# Altium project Main_Board.PrjPcb (part 34 of 44)

## Sheet SFP2.SchDoc: SFP2
size A3; Organization: Altium Limited; Address1: L3, 12a Rodborough Rd; Address2: Frenchs Forest; Address3: NSW; Address4: Australia 2086
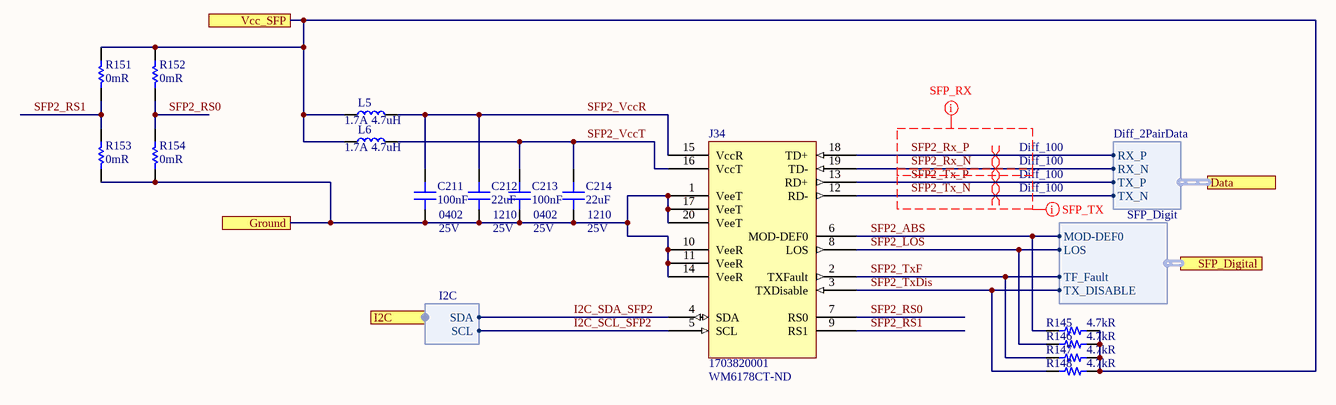
[diagram p54: SFP2.SchDoc]

### Parts
C211  100nF  Case/Package: 0402  Voltage Rating: 25V  [CAP 0402/1005 KK]
C212  22uF  Case/Package: 1210  Voltage Rating: 25V  [CAP 1210/3225 - 1MM]
C213  100nF  Case/Package: 0402  Voltage Rating: 25V  [CAP 0402/1005 KK]
C214  22uF  Case/Package: 1210  Voltage Rating: 25V  [CAP 1210/3225 - 1MM]
J34  1703820001  Supplier Part Number 1: WM6178CT-ND  [1703820001]
L5  Inductance: 4.7uH  Current Rating: 1.7A  [NRS8040]  (hidden comment: NRS4018T4R7MDGJV)
L6  Inductance: 4.7uH  Current Rating: 1.7A  [NRS8040]  (hidden comment: NRS4018T4R7MDGJV)
R145  4.7kR  [RES 0402/1005 RF KK]
R146  4.7kR  [RES 0402/1005 RF KK]
R147  4.7kR  [RES 0402/1005 RF KK]
R148  4.7kR  [RES 0402/1005 RF KK]
R151  0mR  [RES 0402/1005 RF KK]
R152  0mR  [RES 0402/1005 RF KK]
R153  0mR  [RES 0402/1005 RF KK]
R154  0mR  [RES 0402/1005 RF KK]

### Ports
Data (harness Diff_2PairData), Ground, I2C (harness I2C), SFP_Digital (harness SFP_Digit), Vcc_SFP

### Harnesses
I2C: SDA, SCL
SFP_Digit: MOD-DEF0, LOS, TF_Fault, TX_DISABLE
Diff_2PairData: RX_P, RX_N, TX_P, TX_N

### Nets
B503_Ground: C211.1 C212.2 C213.1 C214.2 J34.1(VeeT) J34.10(VeeR) J34.11(VeeR) J34.14(VeeR) J34.17(VeeT) J34.20(VeeT) R153.2 R154.2 ; port Ground
3V3_RAIL: L5.1 L6.1 R145.2 R146.2 R147.2 R148.2 R151.1 R152.1 ; port Vcc_SFP
I2C_SCL_SFP2: J34.5(SCL) ; port I2C.SCL
I2C_SDA_SFP2: J34.4(SDA) ; port I2C.SDA
SFP2_ABS: J34.6(MOD-DEF0) R145.1 ; port SFP_Digital.MOD-DEF0
SFP2_LOS: J34.8(LOS) R146.1 ; port SFP_Digital.LOS
SFP2_RS0: J34.7(RS0) R152.2 R154.1
SFP2_RS1: J34.9(RS1) R151.2 R153.1
SFP2_Rx_N: J34.19(TD-) ; port Data.RX_N
SFP2_Rx_P: J34.18(TD+) ; port Data.RX_P
SFP2_Tx_N: J34.12(RD-) ; port Data.TX_N
SFP2_Tx_P: J34.13(RD+) ; port Data.TX_P
SFP2_TxDis: J34.3(TXDisable) R148.1 ; port SFP_Digital.TX_DISABLE
SFP2_TxF: J34.2(TXFault) R147.1 ; port SFP_Digital.TF_Fault
SFP2_VccR: C211.2 C212.1 J34.15(VccR) L5.2
SFP2_VccT: C213.2 C214.1 J34.16(VccT) L6.2

### Layout directives
differential pair; differential pair class Diff_100: SFP2_Rx_N, SFP2_Rx_P, SFP2_Tx_N, SFP2_Tx_P
net class SFP_RX: SFP2_Rx_N, SFP2_Rx_P
net class SFP_TX: SFP2_Rx_N, SFP2_Tx_N, SFP2_Tx_P

### Notes on the sheet
- Title
- Size:
- Date:
- A3
- Number:
- Time:
- Revision:
- Sheet
- of
- File:

### Library data of the parts
C211 C213 = Capacitor: as C37 on sheet SFP; Supplier 1: Digi-Key; Supplier Part Number 1: 490-14603-1-ND; Stock 1: 89275; Pricing 1: 1 = 0,10000, 10 = 0,03400, 100 = 0,01520, 500 = 0,01088, 1000 = 0,00855, 2500 = 0,00778, 5000 = 0,00715 (USD); RoHS: Yes; Mount: Surface Mount; Weight: 0.000212oz; Case Code (Imperial): 0402; Case Code (Metric): 1005; Min Operating Temperature: -55°C; Max Operating Temperature: 125°C; Packaging: Tape and Reel; Capacitance: 100nF; Termination: SMD/SMT; Composition: Ceramic; Voltage Rating (DC): 25V; Package Quantity: 50000; Length: 0.039inch; Height: 0.5mm; Width: 0.5mm; Thickness: 0.022inch; ComponentLink1URL: http://www.mouser.com/ds/2/281/c02e-2905.pdf?src-supplier=Mouser; ComponentLink1Description: http://www.mouser.com/ds/2/281/c02e-2905.pdf?src-supplier=Mouser; ComponentLink2URL: http://search.murata.co.jp/Ceramy/image/img/A01X/G101/ENG/GRM155R71E104KE14-01.pdf?src-supplier=Digi-Key; ComponentLink2Description: http://search.murata.co.jp/Ceramy/image/img/A01X/G101/ENG/GRM155R71E104KE14-01.pdf?src-supplier=Digi-Key
C212 C214 = Capacitor: as C38 on sheet SFP; Supplier 1: Digi-Key; Supplier Part Number 1: 1276-1101-1-ND; Stock 1: 46396; Pricing 1: 1 = 0,51000, 10 = 0,36300, 100 = 0,23920, 500 = 0,17722 (USD); RoHS: Yes; Mount: Surface Mount; Case Code (Metric): 3225; Case Code (Imperial): 1210; Contact Plating: Tin; Min Operating Temperature: -55°C; Max Operating Temperature: 85°C; Capacitance: 22uF; Packaging: Tape and Reel; Package Quantity: 1; Voltage: 25V; Length: 3.2mm; Height: 2.5mm; Width: 0.098inch; Thickness: 0.106inch; Depth: 2.5mm; Radiation Hardening: No; ComponentLink1URL: https://datasheet.ciiva.com/26947/getdatasheetpartid-358377-26947025.pdf?src-supplier=Verical; ComponentLink1Description: https://datasheet.ciiva.com/26947/getdatasheetpartid-358377-26947025.pdf?src-supplier=Verical; ComponentLink2URL: https://datasheet.ciiva.com/16202/cl32a226kajnnne-16202745.pdf?src-supplier=Future+Electronics; ComponentLink2Description: https://datasheet.ciiva.com/16202/cl32a226kajnnne-16202745.pdf?src-supplier=Future+Electronics; ComponentLink3URL: https://datasheet.ciiva.com/29241/450711-da-01-en-vs-kondensator-1210-29241799.pdf?src-supplier=Conrad; ComponentLink3Description: https://datasheet.ciiva.com/29241/450711-da-01-en-vs-kondensator-1210-29241799.pdf?src-supplier=Conrad
J34 = 1703820001: as J32 on sheet SFP; Supplier 1: Digi-Key; Manufacturer Part Number: 1703820001; RoHS: Yes; Category: Connectors; Stock 1: 248; Pricing 1: 1=2,23000, 10=2,02500, 25=1,90080, 50=1,81820, 100=1,73550 (USD); Mount: Surface Mount; Material: Brass; Contact Plating: Gold; Contact Material: Bronze,Brass,Copper Alloy; Housing Material: Polycarbonate; Housing Color: Black; Min Operating Temperature: -40°C; Max Operating Temperature: 85°C; Number of Positions: 20; Termination: Solder; Number of Positions Loaded: 20; Package Quantity: 960; Number of Contacts: 20; Packaging: Tape and Reel; Max Voltage Rating (DC): 120V; Voltage Rating (AC): 120V; Orientation: Right Angle; Length: 11mm; Pitch: 0.8mm; Depth: 7.87mm; Radiation Hardening: No; REACH SVHC: No SVHC; Halogen Free: Low Halogen; ELV: Compliant; Flammability Rating: UL94 V-0; ComponentLink1URL: https://datasheet.ciiva.com/3966/317371703820001-io-nectors-3966818.pdf?src-supplier=Arrow; ComponentLink1Description: https://datasheet.ciiva.com/3966/317371703820001-io-nectors-3966818.pdf?src-supplier=Arrow; ComponentLink2URL: https://datasheet.ciiva.com/26288/495951703820001-io-nectors-26288395.pdf?src-supplier=Onlinecomponents.com; ComponentLink2Description: https://datasheet.ciiva.com/26288/495951703820001-io-nectors-26288395.pdf?src-supplier=Onlinecomponents.com; ComponentLink3URL: https://datasheet.ciiva.com/26945/getdatasheetpartid-750999-26945324.pdf?src-supplier=Verical; ComponentLink3Description: https://datasheet.ciiva.com/26945/getdatasheetpartid-750999-26945324.pdf?src-supplier=Verical; ComponentLink4URL: https://datasheet.ciiva.com/16077/629941703820001-io-nectors-16077135.pdf?src-supplier=Onlinecomponents.com; ComponentLink4Description: https://datasheet.ciiva.com/16077/629941703820001-io-nectors-16077135.pdf?src-supplier=Onlinecomponents.com; ComponentLink5URL: https://datasheet.ciiva.com/6929/1703820001-sd-6929267.pdf?src-supplier=Digi-Key; ComponentLink5Description: https://datasheet.ciiva.com/6929/1703820001-sd-6929267.pdf?src-supplier=Digi-Key; ComponentLink6URL: https://datasheet.ciiva.com/26915/getdatasheetpartid-410263-26915957.pdf?src-supplier=Verical; ComponentLink6Description: https://datasheet.ciiva.com/26915/getdatasheetpartid-410263-26915957.pdf?src-supplier=Verical; ComponentLink7URL: https://datasheet.ciiva.com/3138/1703820001-io-connectors-3138921.pdf?src-supplier=Avnet; ComponentLink7Description: https://datasheet.ciiva.com/3138/1703820001-io-connectors-3138921.pdf?src-supplier=Avnet; ComponentLink8URL: https://datasheet.ciiva.com/3138/1703820001-io-connectors-3138922.pdf?src-supplier=Avnet; ComponentLink8Description: https://datasheet.ciiva.com/3138/1703820001-io-connectors-3138922.pdf?src-supplier=Avnet; ComponentLink9URL: https://datasheet.ciiva.com/4569/1703820001-io-connectors-230609-4569597.pdf?src-supplier=Mouser; ComponentLink9Description: https://datasheet.ciiva.com/4569/1703820001-io-connectors-230609-4569597.pdf?src-supplier=Mouser
L5 L6 = NRS4018T4R7MDGJV: as L1 on sheet SFP; Supplier 1: Digi-Key; Manufacturer Part Number: NRS4018T4R7MDGJV; RoHS: Yes; Category: Fixed Inductors; Stock 1: 1620; Pricing 1: 1=0,41000, 10=0,35700, 100=0,25500, 500=0,21422, 1000=0,17342 (USD); Mount: Surface Mount; Case/Package: Nonstandard; Weight: 0.003527oz; Core Material: Ferrite; Min Operating Temperature: -40°C; Max Operating Temperature: 125°C; Packaging: Tape and Reel; Tolerance: 20%; Package Quantity: 3500; Shielding: Shielded; Composition: Wirewound; Test Frequency: 100kHz; Max DC Current: 1.7A; Termination: SMD/SMT; Length: 4mm; Height: 1.8mm; Width: 0.157inch; Height - Seated (Max): 0.071inch; Depth: 4mm; Ratings: AEC-Q200; Radiation Hardening: No; Halogen Free: Halogen Free; ComponentLink1URL: https://datasheet.ciiva.com/29697/nrs4018t4r7mdgjv-ss-29697589.pdf?src-supplier=Digi-Key; ComponentLink1Description: https://datasheet.ciiva.com/29697/nrs4018t4r7mdgjv-ss-29697589.pdf?src-supplier=Digi-Key; Supplier Part Number 1: 587-3578-1-ND
R145-R148 = Resistor: as R65-R68 on sheet SFP; Supplier 1: Digi-Key; Supplier Part Number 1: P4.70KLCT-ND; Stock 1: 5361977; Pricing 1: 1 = 0,10000, 10 = 0,05500, 100 = 0,02250, 1000 = 0,01009, 2500 = 0,00876, 5000 = 0,00724 (USD); RoHS: Yes; Mount: Surface Mount; Case/Package: 0402; Number of Pins: 2; Case Code (Imperial): 0402; Case Code (Metric): 1005; Contact Plating: Tin; Min Operating Temperature: -55°C; Max Operating Temperature: 155°C; Resistance: 4.7kR; Packaging: Tape and Reel; Composition: Thick Film; Package Quantity: 1; Termination: SMD/SMT; Voltage Rating (DC): 50V; Number of Terminations: 2; Military Standard: Not; Max Power Dissipation: 100mW; Features: Automotive AEC-Q200; Length: 1mm; Height: 0.35mm; Width: 0.02inch; Depth: 0.5mm; Radiation Hardening: No; Lead Free: Lead Free; REACH SVHC: No SVHC; ComponentLink1URL: https://datasheet.ciiva.com/11821/0900766b80f80784-11821329.pdf?src-supplier=RSComponents; ComponentLink1Description: https://datasheet.ciiva.com/11821/0900766b80f80784-11821329.pdf?src-supplier=RSComponents; ComponentLink2URL: https://datasheet.ciiva.com/30053/aoa0000ce2-30053990.pdf?src-supplier=Onlinecomponents.com; ComponentLink2Description: https://datasheet.ciiva.com/30053/aoa0000ce2-30053990.pdf?src-supplier=Onlinecomponents.com; ComponentLink3URL: https://datasheet.ciiva.com/7830/aoa0000ce2-7830727.pdf?src-supplier=Element14; ComponentLink3Description: https://datasheet.ciiva.com/7830/aoa0000ce2-7830727.pdf?src-supplier=Element14; ComponentLink4URL: https://datasheet.ciiva.com/22781/1678782-22781576.pdf?src-supplier=Farnell; ComponentLink4Description: https://datasheet.ciiva.com/22781/1678782-22781576.pdf?src-supplier=Farnell; ComponentLink5URL: https://datasheet.ciiva.com/9195/aoa0000ce2-9195737.pdf?src-supplier=Avnet; ComponentLink5Description: https://datasheet.ciiva.com/9195/aoa0000ce2-9195737.pdf?src-supplier=Avnet; ComponentLink6URL: https://datasheet.ciiva.com/17213/aoa0000ce2-17213180.pdf?src-supplier=Avnet+Europe; ComponentLink6Description: https://datasheet.ciiva.com/17213/aoa0000ce2-17213180.pdf?src-supplier=Avnet+Europe; ComponentLink7URL: https://datasheet.ciiva.com/22667/1678782-22667886.pdf?src-supplier=Element14; ComponentLink7Description: https://datasheet.ciiva.com/22667/1678782-22667886.pdf?src-supplier=Element14; ComponentLink8URL: https://datasheet.ciiva.com/16763/70260748-16763151.pdf?src-supplier=Allied+Electronics; ComponentLink8Description: https://datasheet.ciiva.com/16763/70260748-16763151.pdf?src-supplier=Allied+Electronics; ComponentLink9URL: https://datasheet.ciiva.com/22723/1678782-22723903.pdf?src-supplier=Element14; ComponentLink9Description: https://datasheet.ciiva.com/22723/1678782-22723903.pdf?src-supplier=Element14; ComponentLink10URL: https://datasheet.ciiva.com/24025/aoa0000ce2-24025663.pdf?src-supplier=Mouser; ComponentLink10Description: https://datasheet.ciiva.com/24025/aoa0000ce2-24025663.pdf?src-supplier=Mouser
R151-R154 = Resistor: as R703#1 on sheet Ext_GPIO_Bank2; Supplier 1: Digi-Key; Supplier Part Number 1: 311-0.0JRCT-ND; Stock 1: 69822252; Pricing 1: 1=0.10000, 10=0.01200, 25=0.00920, 50=0.00680, 100=0.00510, 250=0.00388, 500=0.00308, 1000=0.00227, 5000=0.00163 (USD); RoHS: Yes; Case/Package: 0402; Contact Plating: Tin,Matte; Case Code (Metric): 1005; Case Code (Imperial): 0402; Min Operating Temperature: -55°C; Max Operating Temperature: 155°C; Resistance: 0mR; Packaging: Tape and Reel; Composition: Thick Film; Package Quantity: 1; Number of Terminations: 2; Termination: SMD/SMT; Military Standard: Not; Features: Moisture Resistant; Length: 1mm; Height: 0.016inch; Width: 0.02inch; Depth: 0.5mm; Radiation Hardening: No; REACH SVHC: Unknown; Lead Free: Lead Free; ComponentLink1URL: https://datasheet.ciiva.com/2452/pyu-rc0402-51-rohs-l-6-2452608.pdf?src-supplier=Digi-Key; ComponentLink1Description: https://datasheet.ciiva.com/2452/pyu-rc0402-51-rohs-l-6-2452608.pdf?src-supplier=Digi-Key; ComponentLink2URL: https://datasheet.ciiva.com/11808/0900766b80c66297-11808195.pdf?src-supplier=RSComponents; ComponentLink2Description: https://datasheet.ciiva.com/11808/0900766b80c66297-11808195.pdf?src-supplier=RSComponents; ComponentLink3URL: https://datasheet.ciiva.com/2452/pyu-r-int-thick-7-2452609.pdf?src-supplier=Digi-Key; ComponentLink3Description: https://datasheet.ciiva.com/2452/pyu-r-int-thick-7-2452609.pdf?src-supplier=Digi-Key; ComponentLink4URL: https://datasheet.ciiva.com/22747/1018594-22747515.pdf?src-supplier=Element14; ComponentLink4Description: https://datasheet.ciiva.com/22747/1018594-22747515.pdf?src-supplier=Element14; ComponentLink5URL: https://datasheet.ciiva.com/7983/1018594-7983535.pdf?src-supplier=Element14; ComponentLink5Description: https://datasheet.ciiva.com/7983/1018594-7983535.pdf?src-supplier=Element14; ComponentLink6URL: https://datasheet.ciiva.com/2452/pyu-r-int-thick-7-2452610.pdf?src-supplier=Digi-Key; ComponentLink6Description: https://datasheet.ciiva.com/2452/pyu-r-int-thick-7-2452610.pdf?src-supplier=Digi-Key; ComponentLink7URL: https://datasheet.ciiva.com/8896/pyu-rc0402-51-rohs-l-6-8896201.pdf?src-supplier=Avnet; ComponentLink7Description: https://datasheet.ciiva.com/8896/pyu-rc0402-51-rohs-l-6-8896201.pdf?src-supplier=Avnet; ComponentLink8URL: https://datasheet.ciiva.com/28386/pyu-rc0402-51-rohs-l-6-28386633.pdf?src-supplier=Avnet+Europe; ComponentLink8Description: https://datasheet.ciiva.com/28386/pyu-rc0402-51-rohs-l-6-28386633.pdf?src-supplier=Avnet+Europe; ComponentLink9URL: https://datasheet.ciiva.com/15189/getdatasheetpartid-326379-15189533.pdf?src-supplier=Verical; ComponentLink9Description: https://datasheet.ciiva.com/15189/getdatasheetpartid-326379-15189533.pdf?src-supplier=Verical

## Sheet SFP3.SchDoc: SFP3
size A3; Organization: Altium Limited; Address1: L3, 12a Rodborough Rd; Address2: Frenchs Forest; Address3: NSW; Address4: Australia 2086
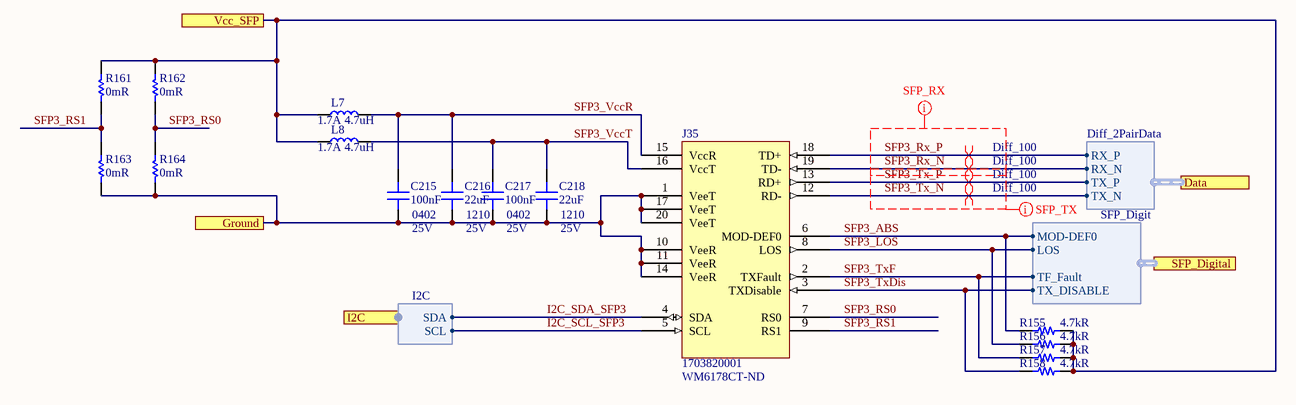
[diagram p55: SFP3.SchDoc]

### Parts
C215  100nF  Case/Package: 0402  Voltage Rating: 25V  [CAP 0402/1005 KK]
C216  22uF  Case/Package: 1210  Voltage Rating: 25V  [CAP 1210/3225 - 1MM]
C217  100nF  Case/Package: 0402  Voltage Rating: 25V  [CAP 0402/1005 KK]
C218  22uF  Case/Package: 1210  Voltage Rating: 25V  [CAP 1210/3225 - 1MM]
J35  1703820001  Supplier Part Number 1: WM6178CT-ND  [1703820001]
L7  Inductance: 4.7uH  Current Rating: 1.7A  [NRS8040]  (hidden comment: NRS4018T4R7MDGJV)
L8  Inductance: 4.7uH  Current Rating: 1.7A  [NRS8040]  (hidden comment: NRS4018T4R7MDGJV)
R155  4.7kR  [RES 0402/1005 RF KK]
R156  4.7kR  [RES 0402/1005 RF KK]
R157  4.7kR  [RES 0402/1005 RF KK]
R158  4.7kR  [RES 0402/1005 RF KK]
R161  0mR  [RES 0402/1005 RF KK]
R162  0mR  [RES 0402/1005 RF KK]
R163  0mR  [RES 0402/1005 RF KK]
R164  0mR  [RES 0402/1005 RF KK]

### Ports
Data (harness Diff_2PairData), Ground, I2C (harness I2C), SFP_Digital (harness SFP_Digit), Vcc_SFP

### Harnesses
I2C: SDA, SCL
SFP_Digit: MOD-DEF0, LOS, TF_Fault, TX_DISABLE
Diff_2PairData: RX_P, RX_N, TX_P, TX_N

### Nets
B503_Ground: C215.1 C216.2 C217.1 C218.2 J35.1(VeeT) J35.10(VeeR) J35.11(VeeR) J35.14(VeeR) J35.17(VeeT) J35.20(VeeT) R163.2 R164.2 ; port Ground
3V3_RAIL: L7.1 L8.1 R155.2 R156.2 R157.2 R158.2 R161.1 R162.1 ; port Vcc_SFP
I2C_SCL_SFP3: J35.5(SCL) ; port I2C.SCL
I2C_SDA_SFP3: J35.4(SDA) ; port I2C.SDA
SFP3_ABS: J35.6(MOD-DEF0) R155.1 ; port SFP_Digital.MOD-DEF0
SFP3_LOS: J35.8(LOS) R156.1 ; port SFP_Digital.LOS
SFP3_RS0: J35.7(RS0) R162.2 R164.1
SFP3_RS1: J35.9(RS1) R161.2 R163.1
SFP3_Rx_N: J35.19(TD-) ; port Data.RX_N
SFP3_Rx_P: J35.18(TD+) ; port Data.RX_P
SFP3_Tx_N: J35.12(RD-) ; port Data.TX_N
SFP3_Tx_P: J35.13(RD+) ; port Data.TX_P
SFP3_TxDis: J35.3(TXDisable) R158.1 ; port SFP_Digital.TX_DISABLE
SFP3_TxF: J35.2(TXFault) R157.1 ; port SFP_Digital.TF_Fault
SFP3_VccR: C215.2 C216.1 J35.15(VccR) L7.2
SFP3_VccT: C217.2 C218.1 J35.16(VccT) L8.2

### Layout directives
differential pair; differential pair class Diff_100: SFP3_Rx_N, SFP3_Rx_P, SFP3_Tx_N, SFP3_Tx_P
net class SFP_RX: SFP3_Rx_N, SFP3_Rx_P
net class SFP_TX: SFP3_Rx_N, SFP3_Tx_N, SFP3_Tx_P

### Notes on the sheet
- Title
- Size:
- Date:
- A3
- Number:
- Time:
- Revision:
- Sheet
- of
- File:

### Library data of the parts
C215 C217 = Capacitor: as C37 on sheet SFP; Supplier 1: Digi-Key; Supplier Part Number 1: 490-14603-1-ND; Stock 1: 89275; Pricing 1: 1 = 0,10000, 10 = 0,03400, 100 = 0,01520, 500 = 0,01088, 1000 = 0,00855, 2500 = 0,00778, 5000 = 0,00715 (USD); RoHS: Yes; Mount: Surface Mount; Weight: 0.000212oz; Case Code (Imperial): 0402; Case Code (Metric): 1005; Min Operating Temperature: -55°C; Max Operating Temperature: 125°C; Packaging: Tape and Reel; Capacitance: 100nF; Termination: SMD/SMT; Composition: Ceramic; Voltage Rating (DC): 25V; Package Quantity: 50000; Length: 0.039inch; Height: 0.5mm; Width: 0.5mm; Thickness: 0.022inch; ComponentLink1URL: http://www.mouser.com/ds/2/281/c02e-2905.pdf?src-supplier=Mouser; ComponentLink1Description: http://www.mouser.com/ds/2/281/c02e-2905.pdf?src-supplier=Mouser; ComponentLink2URL: http://search.murata.co.jp/Ceramy/image/img/A01X/G101/ENG/GRM155R71E104KE14-01.pdf?src-supplier=Digi-Key; ComponentLink2Description: http://search.murata.co.jp/Ceramy/image/img/A01X/G101/ENG/GRM155R71E104KE14-01.pdf?src-supplier=Digi-Key
C216 C218 = Capacitor: as C38 on sheet SFP; Supplier 1: Digi-Key; Supplier Part Number 1: 1276-1101-1-ND; Stock 1: 46396; Pricing 1: 1 = 0,51000, 10 = 0,36300, 100 = 0,23920, 500 = 0,17722 (USD); RoHS: Yes; Mount: Surface Mount; Case Code (Metric): 3225; Case Code (Imperial): 1210; Contact Plating: Tin; Min Operating Temperature: -55°C; Max Operating Temperature: 85°C; Capacitance: 22uF; Packaging: Tape and Reel; Package Quantity: 1; Voltage: 25V; Length: 3.2mm; Height: 2.5mm; Width: 0.098inch; Thickness: 0.106inch; Depth: 2.5mm; Radiation Hardening: No; ComponentLink1URL: https://datasheet.ciiva.com/26947/getdatasheetpartid-358377-26947025.pdf?src-supplier=Verical; ComponentLink1Description: https://datasheet.ciiva.com/26947/getdatasheetpartid-358377-26947025.pdf?src-supplier=Verical; ComponentLink2URL: https://datasheet.ciiva.com/16202/cl32a226kajnnne-16202745.pdf?src-supplier=Future+Electronics; ComponentLink2Description: https://datasheet.ciiva.com/16202/cl32a226kajnnne-16202745.pdf?src-supplier=Future+Electronics; ComponentLink3URL: https://datasheet.ciiva.com/29241/450711-da-01-en-vs-kondensator-1210-29241799.pdf?src-supplier=Conrad; ComponentLink3Description: https://datasheet.ciiva.com/29241/450711-da-01-en-vs-kondensator-1210-29241799.pdf?src-supplier=Conrad
J35 = 1703820001: as J32 on sheet SFP; Supplier 1: Digi-Key; Manufacturer Part Number: 1703820001; RoHS: Yes; Category: Connectors; Stock 1: 248; Pricing 1: 1=2,23000, 10=2,02500, 25=1,90080, 50=1,81820, 100=1,73550 (USD); Mount: Surface Mount; Material: Brass; Contact Plating: Gold; Contact Material: Bronze,Brass,Copper Alloy; Housing Material: Polycarbonate; Housing Color: Black; Min Operating Temperature: -40°C; Max Operating Temperature: 85°C; Number of Positions: 20; Termination: Solder; Number of Positions Loaded: 20; Package Quantity: 960; Number of Contacts: 20; Packaging: Tape and Reel; Max Voltage Rating (DC): 120V; Voltage Rating (AC): 120V; Orientation: Right Angle; Length: 11mm; Pitch: 0.8mm; Depth: 7.87mm; Radiation Hardening: No; REACH SVHC: No SVHC; Halogen Free: Low Halogen; ELV: Compliant; Flammability Rating: UL94 V-0; ComponentLink1URL: https://datasheet.ciiva.com/3966/317371703820001-io-nectors-3966818.pdf?src-supplier=Arrow; ComponentLink1Description: https://datasheet.ciiva.com/3966/317371703820001-io-nectors-3966818.pdf?src-supplier=Arrow; ComponentLink2URL: https://datasheet.ciiva.com/26288/495951703820001-io-nectors-26288395.pdf?src-supplier=Onlinecomponents.com; ComponentLink2Description: https://datasheet.ciiva.com/26288/495951703820001-io-nectors-26288395.pdf?src-supplier=Onlinecomponents.com; ComponentLink3URL: https://datasheet.ciiva.com/26945/getdatasheetpartid-750999-26945324.pdf?src-supplier=Verical; ComponentLink3Description: https://datasheet.ciiva.com/26945/getdatasheetpartid-750999-26945324.pdf?src-supplier=Verical; ComponentLink4URL: https://datasheet.ciiva.com/16077/629941703820001-io-nectors-16077135.pdf?src-supplier=Onlinecomponents.com; ComponentLink4Description: https://datasheet.ciiva.com/16077/629941703820001-io-nectors-16077135.pdf?src-supplier=Onlinecomponents.com; ComponentLink5URL: https://datasheet.ciiva.com/6929/1703820001-sd-6929267.pdf?src-supplier=Digi-Key; ComponentLink5Description: https://datasheet.ciiva.com/6929/1703820001-sd-6929267.pdf?src-supplier=Digi-Key; ComponentLink6URL: https://datasheet.ciiva.com/26915/getdatasheetpartid-410263-26915957.pdf?src-supplier=Verical; ComponentLink6Description: https://datasheet.ciiva.com/26915/getdatasheetpartid-410263-26915957.pdf?src-supplier=Verical; ComponentLink7URL: https://datasheet.ciiva.com/3138/1703820001-io-connectors-3138921.pdf?src-supplier=Avnet; ComponentLink7Description: https://datasheet.ciiva.com/3138/1703820001-io-connectors-3138921.pdf?src-supplier=Avnet; ComponentLink8URL: https://datasheet.ciiva.com/3138/1703820001-io-connectors-3138922.pdf?src-supplier=Avnet; ComponentLink8Description: https://datasheet.ciiva.com/3138/1703820001-io-connectors-3138922.pdf?src-supplier=Avnet; ComponentLink9URL: https://datasheet.ciiva.com/4569/1703820001-io-connectors-230609-4569597.pdf?src-supplier=Mouser; ComponentLink9Description: https://datasheet.ciiva.com/4569/1703820001-io-connectors-230609-4569597.pdf?src-supplier=Mouser
L7 L8 = NRS4018T4R7MDGJV: as L1 on sheet SFP; Supplier 1: Digi-Key; Manufacturer Part Number: NRS4018T4R7MDGJV; RoHS: Yes; Category: Fixed Inductors; Stock 1: 1620; Pricing 1: 1=0,41000, 10=0,35700, 100=0,25500, 500=0,21422, 1000=0,17342 (USD); Mount: Surface Mount; Case/Package: Nonstandard; Weight: 0.003527oz; Core Material: Ferrite; Min Operating Temperature: -40°C; Max Operating Temperature: 125°C; Packaging: Tape and Reel; Tolerance: 20%; Package Quantity: 3500; Shielding: Shielded; Composition: Wirewound; Test Frequency: 100kHz; Max DC Current: 1.7A; Termination: SMD/SMT; Length: 4mm; Height: 1.8mm; Width: 0.157inch; Height - Seated (Max): 0.071inch; Depth: 4mm; Ratings: AEC-Q200; Radiation Hardening: No; Halogen Free: Halogen Free; ComponentLink1URL: https://datasheet.ciiva.com/29697/nrs4018t4r7mdgjv-ss-29697589.pdf?src-supplier=Digi-Key; ComponentLink1Description: https://datasheet.ciiva.com/29697/nrs4018t4r7mdgjv-ss-29697589.pdf?src-supplier=Digi-Key; Supplier Part Number 1: 587-3578-1-ND
R155-R158 = Resistor: as R65-R68 on sheet SFP; Supplier 1: Digi-Key; Supplier Part Number 1: P4.70KLCT-ND; Stock 1: 5361977; Pricing 1: 1 = 0,10000, 10 = 0,05500, 100 = 0,02250, 1000 = 0,01009, 2500 = 0,00876, 5000 = 0,00724 (USD); RoHS: Yes; Mount: Surface Mount; Case/Package: 0402; Number of Pins: 2; Case Code (Imperial): 0402; Case Code (Metric): 1005; Contact Plating: Tin; Min Operating Temperature: -55°C; Max Operating Temperature: 155°C; Resistance: 4.7kR; Packaging: Tape and Reel; Composition: Thick Film; Package Quantity: 1; Termination: SMD/SMT; Voltage Rating (DC): 50V; Number of Terminations: 2; Military Standard: Not; Max Power Dissipation: 100mW; Features: Automotive AEC-Q200; Length: 1mm; Height: 0.35mm; Width: 0.02inch; Depth: 0.5mm; Radiation Hardening: No; Lead Free: Lead Free; REACH SVHC: No SVHC; ComponentLink1URL: https://datasheet.ciiva.com/11821/0900766b80f80784-11821329.pdf?src-supplier=RSComponents; ComponentLink1Description: https://datasheet.ciiva.com/11821/0900766b80f80784-11821329.pdf?src-supplier=RSComponents; ComponentLink2URL: https://datasheet.ciiva.com/30053/aoa0000ce2-30053990.pdf?src-supplier=Onlinecomponents.com; ComponentLink2Description: https://datasheet.ciiva.com/30053/aoa0000ce2-30053990.pdf?src-supplier=Onlinecomponents.com; ComponentLink3URL: https://datasheet.ciiva.com/7830/aoa0000ce2-7830727.pdf?src-supplier=Element14; ComponentLink3Description: https://datasheet.ciiva.com/7830/aoa0000ce2-7830727.pdf?src-supplier=Element14; ComponentLink4URL: https://datasheet.ciiva.com/22781/1678782-22781576.pdf?src-supplier=Farnell; ComponentLink4Description: https://datasheet.ciiva.com/22781/1678782-22781576.pdf?src-supplier=Farnell; ComponentLink5URL: https://datasheet.ciiva.com/9195/aoa0000ce2-9195737.pdf?src-supplier=Avnet; ComponentLink5Description: https://datasheet.ciiva.com/9195/aoa0000ce2-9195737.pdf?src-supplier=Avnet; ComponentLink6URL: https://datasheet.ciiva.com/17213/aoa0000ce2-17213180.pdf?src-supplier=Avnet+Europe; ComponentLink6Description: https://datasheet.ciiva.com/17213/aoa0000ce2-17213180.pdf?src-supplier=Avnet+Europe; ComponentLink7URL: https://datasheet.ciiva.com/22667/1678782-22667886.pdf?src-supplier=Element14; ComponentLink7Description: https://datasheet.ciiva.com/22667/1678782-22667886.pdf?src-supplier=Element14; ComponentLink8URL: https://datasheet.ciiva.com/16763/70260748-16763151.pdf?src-supplier=Allied+Electronics; ComponentLink8Description: https://datasheet.ciiva.com/16763/70260748-16763151.pdf?src-supplier=Allied+Electronics; ComponentLink9URL: https://datasheet.ciiva.com/22723/1678782-22723903.pdf?src-supplier=Element14; ComponentLink9Description: https://datasheet.ciiva.com/22723/1678782-22723903.pdf?src-supplier=Element14; ComponentLink10URL: https://datasheet.ciiva.com/24025/aoa0000ce2-24025663.pdf?src-supplier=Mouser; ComponentLink10Description: https://datasheet.ciiva.com/24025/aoa0000ce2-24025663.pdf?src-supplier=Mouser
R161-R164 = Resistor: as R703#1 on sheet Ext_GPIO_Bank2; Supplier 1: Digi-Key; Supplier Part Number 1: 311-0.0JRCT-ND; Stock 1: 69822252; Pricing 1: 1=0.10000, 10=0.01200, 25=0.00920, 50=0.00680, 100=0.00510, 250=0.00388, 500=0.00308, 1000=0.00227, 5000=0.00163 (USD); RoHS: Yes; Case/Package: 0402; Contact Plating: Tin,Matte; Case Code (Metric): 1005; Case Code (Imperial): 0402; Min Operating Temperature: -55°C; Max Operating Temperature: 155°C; Resistance: 0mR; Packaging: Tape and Reel; Composition: Thick Film; Package Quantity: 1; Number of Terminations: 2; Termination: SMD/SMT; Military Standard: Not; Features: Moisture Resistant; Length: 1mm; Height: 0.016inch; Width: 0.02inch; Depth: 0.5mm; Radiation Hardening: No; REACH SVHC: Unknown; Lead Free: Lead Free; ComponentLink1URL: https://datasheet.ciiva.com/2452/pyu-rc0402-51-rohs-l-6-2452608.pdf?src-supplier=Digi-Key; ComponentLink1Description: https://datasheet.ciiva.com/2452/pyu-rc0402-51-rohs-l-6-2452608.pdf?src-supplier=Digi-Key; ComponentLink2URL: https://datasheet.ciiva.com/11808/0900766b80c66297-11808195.pdf?src-supplier=RSComponents; ComponentLink2Description: https://datasheet.ciiva.com/11808/0900766b80c66297-11808195.pdf?src-supplier=RSComponents; ComponentLink3URL: https://datasheet.ciiva.com/2452/pyu-r-int-thick-7-2452609.pdf?src-supplier=Digi-Key; ComponentLink3Description: https://datasheet.ciiva.com/2452/pyu-r-int-thick-7-2452609.pdf?src-supplier=Digi-Key; ComponentLink4URL: https://datasheet.ciiva.com/22747/1018594-22747515.pdf?src-supplier=Element14; ComponentLink4Description: https://datasheet.ciiva.com/22747/1018594-22747515.pdf?src-supplier=Element14; ComponentLink5URL: https://datasheet.ciiva.com/7983/1018594-7983535.pdf?src-supplier=Element14; ComponentLink5Description: https://datasheet.ciiva.com/7983/1018594-7983535.pdf?src-supplier=Element14; ComponentLink6URL: https://datasheet.ciiva.com/2452/pyu-r-int-thick-7-2452610.pdf?src-supplier=Digi-Key; ComponentLink6Description: https://datasheet.ciiva.com/2452/pyu-r-int-thick-7-2452610.pdf?src-supplier=Digi-Key; ComponentLink7URL: https://datasheet.ciiva.com/8896/pyu-rc0402-51-rohs-l-6-8896201.pdf?src-supplier=Avnet; ComponentLink7Description: https://datasheet.ciiva.com/8896/pyu-rc0402-51-rohs-l-6-8896201.pdf?src-supplier=Avnet; ComponentLink8URL: https://datasheet.ciiva.com/28386/pyu-rc0402-51-rohs-l-6-28386633.pdf?src-supplier=Avnet+Europe; ComponentLink8Description: https://datasheet.ciiva.com/28386/pyu-rc0402-51-rohs-l-6-28386633.pdf?src-supplier=Avnet+Europe; ComponentLink9URL: https://datasheet.ciiva.com/15189/getdatasheetpartid-326379-15189533.pdf?src-supplier=Verical; ComponentLink9Description: https://datasheet.ciiva.com/15189/getdatasheetpartid-326379-15189533.pdf?src-supplier=Verical

## Sheet bank226.SchDoc: Bank226
size A3; Organization: Altium Limited; Address1: L3, 12a Rodborough Rd; Address2: Frenchs Forest; Address3: NSW; Address4: Australia 2086
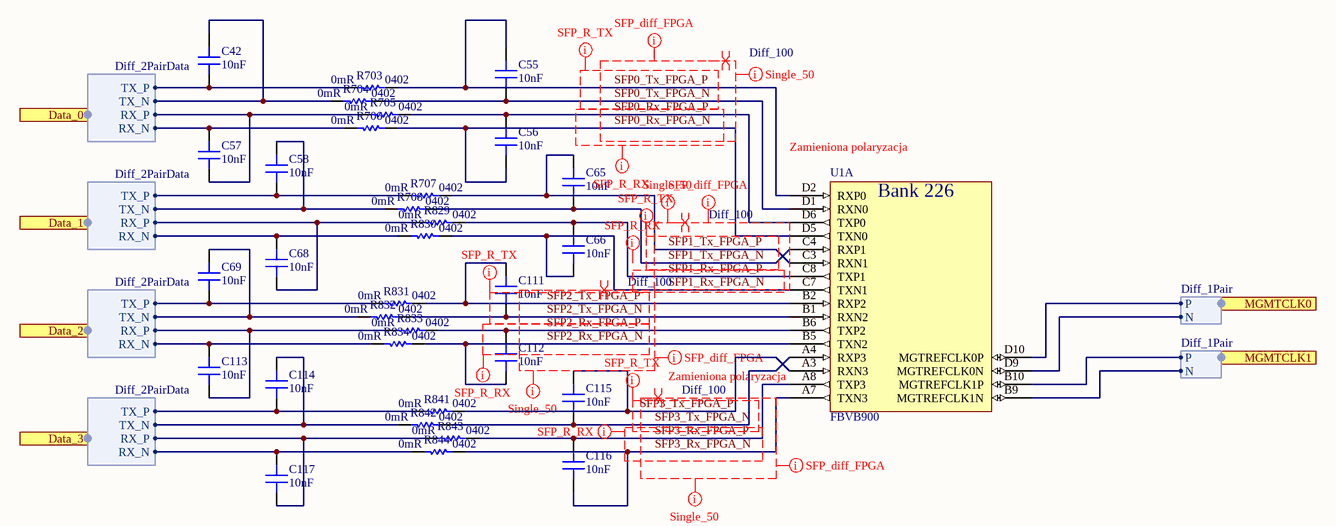
[diagram p56: bank226.SchDoc]

### Parts
(Parts that share a designator on the sheet are numbered #1, #2 ... from top to bottom, then left to right.)
C42  10nF  [CAP 0402/1005 KK]
C55#2  10nF  [CAP 0402/1005 KK]
C56#2  10nF  [CAP 0402/1005 KK]
C57#2  10nF  [CAP 0402/1005 KK]
C58#2  10nF  [CAP 0402/1005 KK]
C65#2  10nF  [CAP 0402/1005 KK]
C66#2  10nF  [CAP 0402/1005 KK]
C68#2  10nF  [CAP 0402/1005 KK]
C69#2  10nF  [CAP 0402/1005 KK]
C111#2  10nF  [CAP 0402/1005 KK]
C112#2  10nF  [CAP 0402/1005 KK]
C113#2  10nF  [CAP 0402/1005 KK]
C114#2  10nF  [CAP 0402/1005 KK]
C115#2  10nF  [CAP 0402/1005 KK]
C116#2  10nF  [CAP 0402/1005 KK]
C117#2  10nF  [CAP 0402/1005 KK]
R703#2  0mR  Case/Package: 0402  [RES 0402/1005 RF KK]
R704#2  0mR  Case/Package: 0402  [RES 0402/1005 RF KK]
R705#2  0mR  Case/Package: 0402  [RES 0402/1005 RF KK]
R706#2  0mR  Case/Package: 0402  [RES 0402/1005 RF KK]
R707#2  0mR  Case/Package: 0402  [RES 0402/1005 RF KK]
R708#2  0mR  Case/Package: 0402  [RES 0402/1005 RF KK]
R829#2  0mR  Case/Package: 0402  [RES 0402/1005 RF KK]
R830#2  0mR  Case/Package: 0402  [RES 0402/1005 RF KK]
R831#2  0mR  Case/Package: 0402  [RES 0402/1005 RF KK]
R832#2  0mR  Case/Package: 0402  [RES 0402/1005 RF KK]
R833#2  0mR  Case/Package: 0402  [RES 0402/1005 RF KK]
R834#2  0mR  Case/Package: 0402  [RES 0402/1005 RF KK]
R841#2  0mR  Case/Package: 0402  [RES 0402/1005 RF KK]
R842#2  0mR  Case/Package: 0402  [RES 0402/1005 RF KK]
R843#2  0mR  Case/Package: 0402  [RES 0402/1005 RF KK]
R844#2  0mR  Case/Package: 0402  [RES 0402/1005 RF KK]
U1  FBVB900  [FBVB900 XX]  (part A of 23)

### Ports
Data_0 (harness Diff_2PairData), Data_1 (harness Diff_2PairData), Data_2 (harness Diff_2PairData), Data_3 (harness Diff_2PairData), MGMTCLK0 (harness Diff_1Pair), MGMTCLK1 (harness Diff_1Pair)

### Harnesses
Diff_2PairData: RX_P, RX_N, TX_P, TX_N
Diff_1Pair: P, N

### Nets
LTC6952_1_MATCH_Out0_N: U1.D9(MGTREFCLK0N) ; port MGMTCLK0.N
LTC6952_1_MATCH_Out0_P: U1.D10(MGTREFCLK0P) ; port MGMTCLK0.P
SFP0_Rx_FPGA_N: C56#2.1 R706#2.1 U1.D5(TXN0)
SFP0_Rx_FPGA_P: C56#2.2 R705#2.1 U1.D6(TXP0)
SFP0_Rx_N: C57#2.2 R706#2.2 ; port Data_0.RX_N
SFP0_Rx_P: C57#2.1 R705#2.2 ; port Data_0.RX_P
SFP0_Tx_FPGA_N: C55#2.1 R704#2.1 U1.D1(RXN0)
SFP0_Tx_FPGA_P: C55#2.2 R703#2.1 U1.D2(RXP0)
SFP0_Tx_N: C42.2 R704#2.2 ; port Data_0.TX_N
SFP0_Tx_P: C42.1 R703#2.2 ; port Data_0.TX_P
SFP1_Rx_FPGA_N: C66#2.1 R830#2.1 U1.C7(TXN1)
SFP1_Rx_FPGA_P: C66#2.2 R829#2.1 U1.C8(TXP1)
SFP1_Rx_N: C68#2.2 R830#2.2 ; port Data_1.RX_N
SFP1_Rx_P: C68#2.1 R829#2.2 ; port Data_1.RX_P
SFP1_Tx_FPGA_N: C65#2.1 R708#2.1 U1.C4(RXP1)
SFP1_Tx_FPGA_P: C65#2.2 R707#2.1 U1.C3(RXN1)
SFP1_Tx_N: C58#2.2 R708#2.2 ; port Data_1.TX_N
SFP1_Tx_P: C58#2.1 R707#2.2 ; port Data_1.TX_P
SFP2_Rx_FPGA_N: C112#2.1 R834#2.1 U1.B5(TXN2)
SFP2_Rx_FPGA_P: C112#2.2 R833#2.1 U1.B6(TXP2)
SFP2_Rx_N: C113#2.2 R834#2.2 ; port Data_2.RX_N
SFP2_Rx_P: C113#2.1 R833#2.2 ; port Data_2.RX_P
SFP2_Tx_FPGA_N: C111#2.1 R832#2.1 U1.B1(RXN2)
SFP2_Tx_FPGA_P: C111#2.2 R831#2.1 U1.B2(RXP2)
SFP2_Tx_N: C69#2.2 R832#2.2 ; port Data_2.TX_N
SFP2_Tx_P: C69#2.1 R831#2.2 ; port Data_2.TX_P
SFP3_Rx_FPGA_N: C116#2.1 R844#2.1 U1.A7(TXN3)
SFP3_Rx_FPGA_P: C116#2.2 R843#2.1 U1.A8(TXP3)
SFP3_Rx_N: C117#2.2 R844#2.2 ; port Data_3.RX_N
SFP3_Rx_P: C117#2.1 R843#2.2 ; port Data_3.RX_P
SFP3_Tx_FPGA_N: C115#2.1 R842#2.1 U1.A4(RXP3)
SFP3_Tx_FPGA_P: C115#2.2 R841#2.1 U1.A3(RXN3)
SFP3_Tx_N: C114#2.2 R842#2.2 ; port Data_3.TX_N
SFP3_Tx_P: C114#2.1 R841#2.2 ; port Data_3.TX_P
NetU1_B9: U1.B9(MGTREFCLK1N) ; port MGMTCLK1.N
NetU1_B10: U1.B10(MGTREFCLK1P) ; port MGMTCLK1.P

### Layout directives
differential pair; differential pair class Diff_100: SFP0_Rx_FPGA_N, SFP0_Rx_FPGA_P, SFP0_Tx_FPGA_N, SFP0_Tx_FPGA_P, SFP1_Rx_FPGA_N, SFP1_Rx_FPGA_P, SFP1_Tx_FPGA_N, SFP1_Tx_FPGA_P, SFP2_Rx_FPGA_N, SFP2_Rx_FPGA_P, SFP2_Tx_FPGA_N, SFP2_Tx_FPGA_P, SFP3_Rx_FPGA_N, SFP3_Rx_FPGA_P, SFP3_Tx_FPGA_N
net class SFP_diff_FPGA: SFP0_Rx_FPGA_N, SFP0_Rx_FPGA_P, SFP0_Tx_FPGA_N, SFP0_Tx_FPGA_P, SFP1_Rx_FPGA_N, SFP1_Rx_FPGA_P, SFP1_Tx_FPGA_N, SFP1_Tx_FPGA_P, SFP2_Rx_FPGA_N, SFP2_Rx_FPGA_P, SFP2_Tx_FPGA_N, SFP2_Tx_FPGA_P, SFP3_Rx_FPGA_N, SFP3_Rx_FPGA_P, SFP3_Tx_FPGA_N
net class Single_50: SFP0_Rx_FPGA_N, SFP0_Rx_FPGA_P, SFP0_Tx_FPGA_N, SFP0_Tx_FPGA_P, SFP1_Rx_FPGA_N, SFP1_Rx_FPGA_P, SFP1_Tx_FPGA_N, SFP1_Tx_FPGA_P, SFP2_Rx_FPGA_N, SFP2_Rx_FPGA_P, SFP2_Tx_FPGA_N, SFP2_Tx_FPGA_P, SFP3_Rx_FPGA_N, SFP3_Rx_FPGA_P, SFP3_Tx_FPGA_N
net class SFP_R_RX: (no net found under the mark), SFP0_Rx_FPGA_N, SFP0_Rx_FPGA_P, SFP2_Rx_FPGA_N, SFP2_Rx_FPGA_P, SFP3_Rx_FPGA_N, SFP3_Rx_FPGA_P
net class SFP_R_TX: SFP0_Tx_FPGA_N, SFP0_Tx_FPGA_P, SFP1_Tx_FPGA_N, SFP1_Tx_FPGA_P, SFP2_Tx_FPGA_N, SFP2_Tx_FPGA_P, SFP3_Tx_FPGA_N, SFP3_Tx_FPGA_P

### Notes on the sheet
- (near U1) Zamieniona polaryzacja
- Title
- Size:
- Date:
- A3
- Number:
- Time:
- Revision:
- Sheet
- of
- File:
- (in symbol FBVB900, part A) Bank 226

### Library data of the parts
C42 C55#2 C56#2 C57#2 C58#2 C65#2 C66#2 C68#2 C69#2 C111#2 C112#2 C113#2 C114#2 C115#2 C116#2 C117#2 = Capacitor: Manufacturer: KEMET; Manufacturer Part Number: C0402C103K4RACTU; Dielectric Material: Ceramic; Tolerance: 10%; Voltage Rating (DC): 16V; Dielectric: X7R; Dissipation Factor: 3.5%; Supplier 1: Digi-Key; Supplier Part Number 1: 399-1038-1-ND; Stock 1: 1112674; Pricing 1: 1 = 0,10000, 10 = 0,02800, 100 = 0,01240, 500 = 0,00886, 1000 = 0,00696, 2500 = 0,00632, 5000 = 0,00582 (USD); RoHS: Yes; Mount: Surface Mount,PCB; Case/Package: 0402; Number of Pins: 2; Case Code (Metric): 1005; Case Code (Imperial): 0402; Contact Plating: Tin,Matte; Min Operating Temperature: -55°C; Max Operating Temperature: 125°C; Capacitance: 10nF; Packaging: Tape and Reel; Package Quantity: 1; Voltage Rating: 16V; Termination: SMD/SMT; Voltage: 16V; Length: 1mm; Height: 0.5mm; Width: 0.02inch; Depth: 0.5mm; Thickness: 0.022inch; Lead Pitch: 0.3mm; Radiation Hardening: No; REACH SVHC: No SVHC; ComponentLink1URL: https://datasheet.ciiva.com/14595/70095383-14595321.pdf?src-supplier=Allied+Electronics; ComponentLink1Description: https://datasheet.ciiva.com/14595/70095383-14595321.pdf?src-supplier=Allied+Electronics; ComponentLink2URL: https://datasheet.ciiva.com/7747/kem-c1002-x7r-smd-7747614.pdf?src-supplier=Element14; ComponentLink2Description: https://datasheet.ciiva.com/7747/kem-c1002-x7r-smd-7747614.pdf?src-supplier=Element14
R703#2 R704#2 R705#2 R706#2 R707#2 R708#2 R829#2 R830#2 R831#2 R832#2 R833#2 R834#2 R841#2 R842#2 R843#2 R844#2 = Resistor: as R703#1 on sheet Ext_GPIO_Bank2; Supplier 1: Digi-Key; Supplier Part Number 1: 311-0.0JRCT-ND; Stock 1: 69822252; Pricing 1: 1=0.10000, 10=0.01200, 25=0.00920, 50=0.00680, 100=0.00510, 250=0.00388, 500=0.00308, 1000=0.00227, 5000=0.00163 (USD); RoHS: Yes; Contact Plating: Tin,Matte; Case Code (Metric): 1005; Case Code (Imperial): 0402; Min Operating Temperature: -55°C; Max Operating Temperature: 155°C; Resistance: 0mR; Packaging: Tape and Reel; Composition: Thick Film; Package Quantity: 1; Number of Terminations: 2; Termination: SMD/SMT; Military Standard: Not; Features: Moisture Resistant; Length: 1mm; Height: 0.016inch; Width: 0.02inch; Depth: 0.5mm; Radiation Hardening: No; REACH SVHC: Unknown; Lead Free: Lead Free; ComponentLink1URL: https://datasheet.ciiva.com/2452/pyu-rc0402-51-rohs-l-6-2452608.pdf?src-supplier=Digi-Key; ComponentLink1Description: https://datasheet.ciiva.com/2452/pyu-rc0402-51-rohs-l-6-2452608.pdf?src-supplier=Digi-Key; ComponentLink2URL: https://datasheet.ciiva.com/11808/0900766b80c66297-11808195.pdf?src-supplier=RSComponents; ComponentLink2Description: https://datasheet.ciiva.com/11808/0900766b80c66297-11808195.pdf?src-supplier=RSComponents; ComponentLink3URL: https://datasheet.ciiva.com/2452/pyu-r-int-thick-7-2452609.pdf?src-supplier=Digi-Key; ComponentLink3Description: https://datasheet.ciiva.com/2452/pyu-r-int-thick-7-2452609.pdf?src-supplier=Digi-Key; ComponentLink4URL: https://datasheet.ciiva.com/22747/1018594-22747515.pdf?src-supplier=Element14; ComponentLink4Description: https://datasheet.ciiva.com/22747/1018594-22747515.pdf?src-supplier=Element14; ComponentLink5URL: https://datasheet.ciiva.com/7983/1018594-7983535.pdf?src-supplier=Element14; ComponentLink5Description: https://datasheet.ciiva.com/7983/1018594-7983535.pdf?src-supplier=Element14; ComponentLink6URL: https://datasheet.ciiva.com/2452/pyu-r-int-thick-7-2452610.pdf?src-supplier=Digi-Key; ComponentLink6Description: https://datasheet.ciiva.com/2452/pyu-r-int-thick-7-2452610.pdf?src-supplier=Digi-Key; ComponentLink7URL: https://datasheet.ciiva.com/8896/pyu-rc0402-51-rohs-l-6-8896201.pdf?src-supplier=Avnet; ComponentLink7Description: https://datasheet.ciiva.com/8896/pyu-rc0402-51-rohs-l-6-8896201.pdf?src-supplier=Avnet; ComponentLink8URL: https://datasheet.ciiva.com/28386/pyu-rc0402-51-rohs-l-6-28386633.pdf?src-supplier=Avnet+Europe; ComponentLink8Description: https://datasheet.ciiva.com/28386/pyu-rc0402-51-rohs-l-6-28386633.pdf?src-supplier=Avnet+Europe; ComponentLink9URL: https://datasheet.ciiva.com/15189/getdatasheetpartid-326379-15189533.pdf?src-supplier=Verical; ComponentLink9Description: https://datasheet.ciiva.com/15189/getdatasheetpartid-326379-15189533.pdf?src-supplier=Verical
U1 = FBVB900: FPGA Zynq UltraScale+ Family 192150 Cells 20nm Technology 0.85V 900-Pin FCBGA Tray; Manufacturer Part Number: XCZU4CG-1FBVB900E; Manufacturer: Xilinx; Peripherals: WDT,DMA; Interface: I2C,SPI,USB,Ethernet,MMC,SDIO,SD,UART,USART,EBI/EMI; Core Architecture: ARM; RAM Size: 256KB; Frequency: 500MHz; Number of I/Os: 204; Supplier 1: Mouser; Supplier Part Number 1: 217-CZU4CG-1FBVB900E; Stock 1: 3; Pricing 1: 1=0,00000, 5=1060,70000 (USD); RoHS: No; Case/Package: FCBGA; Min Operating Temperature: 0°C; Max Operating Temperature: 100°C; Packaging: Tray; ComponentLink1URL: https://www.xilinx.com/support/documentation/data_sheets/ds891-zynq-ultrascale-plus-overview.pdf?src-supplier=Digi-Key; ComponentLink1Description: https://www.xilinx.com/support/documentation/data_sheets/ds891-zynq-ultrascale-plus-overview.pdf?src-supplier=Digi-Key; ComponentLink2URL: https://www.xilinx.com/support/documentation/data_sheets/ds925-zynq-ultrascale-plus.pdf?src-supplier=Digi-Key; ComponentLink2Description: https://www.xilinx.com/support/documentation/data_sheets/ds925-zynq-ultrascale-plus.pdf?src-supplier=Digi-Key; Supplier 2: Avnet; Supplier 3: Digi-Key; Supplier Part Number 2: XCZU4CG-1FBVB900E; Supplier Part Number 3: XCZU4CG-1FBVB900E-ND

## Sheet IMU.SchDoc: IMU
size A3
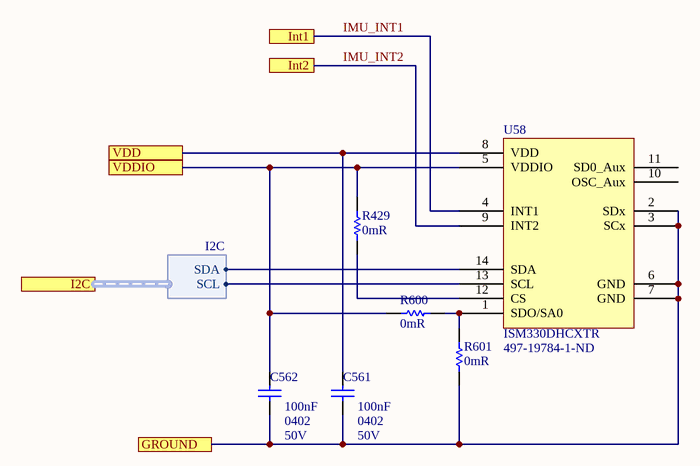
[diagram p57: IMU.SchDoc]

### Parts
C561  100nF  Case Code (Imperial): 0402  Voltage: 50V  [CAP 0402/1005 KK]
C562  100nF  Case Code (Imperial): 0402  Voltage: 50V  [CAP 0402/1005 KK]
R429  0mR  [RES 0402/1005 RF KK]
R600  0mR  [RES 0402/1005 RF KK]
R601  0mR  [RES 0402/1005 RF KK]
U58  ISM330DHCXTR  Supplier Part Number 1: 497-19784-1-ND  [ISM330DHCXL]

### Ports
GROUND, I2C (harness I2C), Int1, Int2, VDD, VDDIO

### Harnesses
I2C: SCL, SDA

### Nets
B503_Ground: C561.1 C562.1 R601.1 U58.2(SDx) U58.3(SCx) U58.6(GND) U58.7(GND) ; port GROUND
1V8@1.5A: C561.2 U58.8(VDD) ; port VDD
3V3_RAIL: C562.2 R429.2 R600.2 U58.5(VDDIO) ; port VDDIO
IMU_INT1: U58.4(INT1) ; port Int1
IMU_INT2: U58.9(INT2) ; port Int2
SFP_I2C4.SCL: U58.13(SCL) ; port I2C.SCL
SFP_I2C4.SDA: U58.14(SDA) ; port I2C.SDA
NetR429_1: R429.1 U58.12(CS)
NetR600_1: R600.1 R601.2 U58.1(SDO/SA0)

Not connected (* = marked no-connect by the designer): U58 10(OSC_Aux) 11(SD0_Aux)

### Notes on the sheet
- Title
- Size:
- Date:
- A3
- Number:
- Time:
- Revision:
- Sheet
- of
- File:

### Library data of the parts
C561 C562 = Capacitor: CAP CER 0.1UF 50V X5R 0402; Manufacturer: Murata; Manufacturer Part Number: GRM155R61H104KE14D; Dielectric Material: Ceramic; Dissipation Factor: 0.025%; Tolerance: 10%; Supplier 1: Digi-Key; Supplier Part Number 1: 490-10697-1-ND; RoHS: Yes; Category: Ceramic Capacitors; Stock 1: 435607; Pricing 1: 1=0,10000, 10=0,04600, 100=0,02050, 500=0,01464, 1000=0,01150, 2500=0,01045, 5000=0,00961 (USD); Mount: Surface Mount; Case/Package: 0402; Weight: 0.000212oz; Case Code (Metric): 1005; Min Operating Temperature: -55°C; Max Operating Temperature: 85°C; Capacitance: 100nF; Packaging: Tape and Reel; Voltage Rating: 50V; Dielectric: X5R; Termination: SMD/SMT; Composition: Ceramic; Voltage Rating (DC): 50V; Package Quantity: 10000; Length: 1mm; Height: 0.5mm; Width: 0.02inch; Thickness: 0.022inch; Depth: 0.5mm; REACH SVHC: No SVHC; Lead Free: Lead Free; ComponentLink1URL: http://www.farnell.com/datasheets/2079150.pdf?src-supplier=Farnell; ComponentLink1Description: http://www.farnell.com/datasheets/2079150.pdf?src-supplier=Farnell; ComponentLink2URL: http://www.mouser.com/ds/2/281/c02e-2905.pdf?src-supplier=Mouser; ComponentLink2Description: http://www.mouser.com/ds/2/281/c02e-2905.pdf?src-supplier=Mouser; ComponentLink3URL: http://www.farnell.com/datasheets/2079150.pdf?src-supplier=Element14; ComponentLink3Description: http://www.farnell.com/datasheets/2079150.pdf?src-supplier=Element14; ComponentLink4URL: http://search.murata.co.jp/Ceramy/image/img/A01X/G101/ENG/GRM155R61H104KE14-01.pdf?src-supplier=Digi-Key; ComponentLink4Description: http://search.murata.co.jp/Ceramy/image/img/A01X/G101/ENG/GRM155R61H104KE14-01.pdf?src-supplier=Digi-Key
R429 R600 R601 = Resistor: Manufacturer: Yageo; Manufacturer Part Number: RC0402JR-070RL; Power Rating: 62.5mW; Tolerance: 5%; Voltage Rating: 50V; Max Power Dissipation: 63mW; Temperature Coefficient: 200ppm/°C; Supplier 1: Digi-Key; Supplier Part Number 1: 311-0.0JRCT-ND; Stock 1: 49660037; Pricing 1: 1 = 0,10000, 10 = 0,01300, 25 = 0,00920, 50 = 0,00720, 100 = 0,00530, 250 = 0,00400, 500 = 0,00320, 1000 = 0,00236, 5000 = 0,00169 (USD); RoHS: Yes; Case/Package: 0402; Contact Plating: Tin,Matte; Case Code (Metric): 1005; Case Code (Imperial): 0402; Min Operating Temperature: -55°C; Max Operating Temperature: 155°C; Resistance: 0mR; Packaging: Tape and Reel; Composition: Thick Film; Package Quantity: 1; Number of Terminations: 2; Termination: SMD/SMT; Military Standard: Not; Features: Moisture Resistant; Length: 1mm; Height: 0.016inch; Width: 0.02inch; Depth: 0.5mm; Radiation Hardening: No; REACH SVHC: Unknown; Lead Free: Lead Free; ComponentLink1URL: https://datasheet.ciiva.com/11808/0900766b80c66297-11808195.pdf?src-supplier=RSComponents; ComponentLink1Description: https://datasheet.ciiva.com/11808/0900766b80c66297-11808195.pdf?src-supplier=RSComponents; ComponentLink2URL: https://datasheet.ciiva.com/2452/pyu-rc0402-51-rohs-l-6-2452608.pdf?src-supplier=Digi-Key; ComponentLink2Description: https://datasheet.ciiva.com/2452/pyu-rc0402-51-rohs-l-6-2452608.pdf?src-supplier=Digi-Key; ComponentLink3URL: https://datasheet.ciiva.com/2452/pyu-r-int-thick-7-2452609.pdf?src-supplier=Digi-Key; ComponentLink3Description: https://datasheet.ciiva.com/2452/pyu-r-int-thick-7-2452609.pdf?src-supplier=Digi-Key; ComponentLink4URL: https://datasheet.ciiva.com/2452/pyu-r-int-thick-7-2452610.pdf?src-supplier=Digi-Key; ComponentLink4Description: https://datasheet.ciiva.com/2452/pyu-r-int-thick-7-2452610.pdf?src-supplier=Digi-Key; ComponentLink5URL: https://datasheet.ciiva.com/28386/pyu-rc0402-51-rohs-l-6-28386633.pdf?src-supplier=Avnet+Europe; ComponentLink5Description: https://datasheet.ciiva.com/28386/pyu-rc0402-51-rohs-l-6-28386633.pdf?src-supplier=Avnet+Europe; ComponentLink6URL: https://datasheet.ciiva.com/22747/1018594-22747515.pdf?src-supplier=Element14; ComponentLink6Description: https://datasheet.ciiva.com/22747/1018594-22747515.pdf?src-supplier=Element14; ComponentLink7URL: https://datasheet.ciiva.com/7983/1018594-7983535.pdf?src-supplier=Element14; ComponentLink7Description: https://datasheet.ciiva.com/7983/1018594-7983535.pdf?src-supplier=Element14; ComponentLink8URL: https://datasheet.ciiva.com/8896/pyu-rc0402-51-rohs-l-6-8896201.pdf?src-supplier=Avnet; ComponentLink8Description: https://datasheet.ciiva.com/8896/pyu-rc0402-51-rohs-l-6-8896201.pdf?src-supplier=Avnet; ComponentLink9URL: https://datasheet.ciiva.com/15189/getdatasheetpartid-326379-15189533.pdf?src-supplier=Verical; ComponentLink9Description: https://datasheet.ciiva.com/15189/getdatasheetpartid-326379-15189533.pdf?src-supplier=Verical
U58 = ISM330DHCXTR: Manufacturer 1: STMicroelectronics; Supplier 1: Digi-Key; Manufacturer Part Number 1: ISM330DHCXTR; Stock 1: 4928; Pricing 1: 1=7,85000, 10=7,09500, 25=6,76520, 100=5,87400, 500=5,11500, 1000=4,45500 (USD); RoHS: No; ComponentLink1Description: Datasheet; ComponentLink1URL: https://www.st.com/resource/en/datasheet/ism330dhcx.pdf